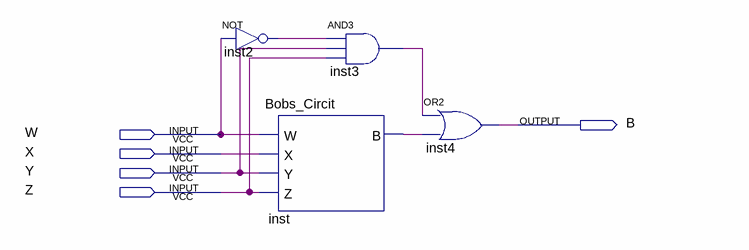
[diagram p0: schematic sheet]
// Quartus schematic Block1.bdf as structural Verilog: 4 symbols, 5 pins
module Block1 (
  input  W,
  input  X,
  input  Y,
  input  Z,
  output B
);

  wire inst2_out, inst3_out, inst_b;

  not inst2 (inst2_out, W);
  Bobs_Circit inst (.W(W), .X(X), .Y(Y), .Z(Z), .B(inst_b));
  and inst3 (inst3_out, inst2_out, Y, Z);
  or inst4 (B, inst3_out, inst_b);
endmodule
